# EasyEDA Pro project 蓝牙串口PCB.eprj

# Schematic Schematic1
Board Name: Board1; Create Date: 2025-01-18; Page Name: P1; Project Name: 蓝牙串口; Schematic Name: Schematic1; Update Date: 2026-01-01; Company: 嘉立创EDA; Page Size: A4; Version: V1.0
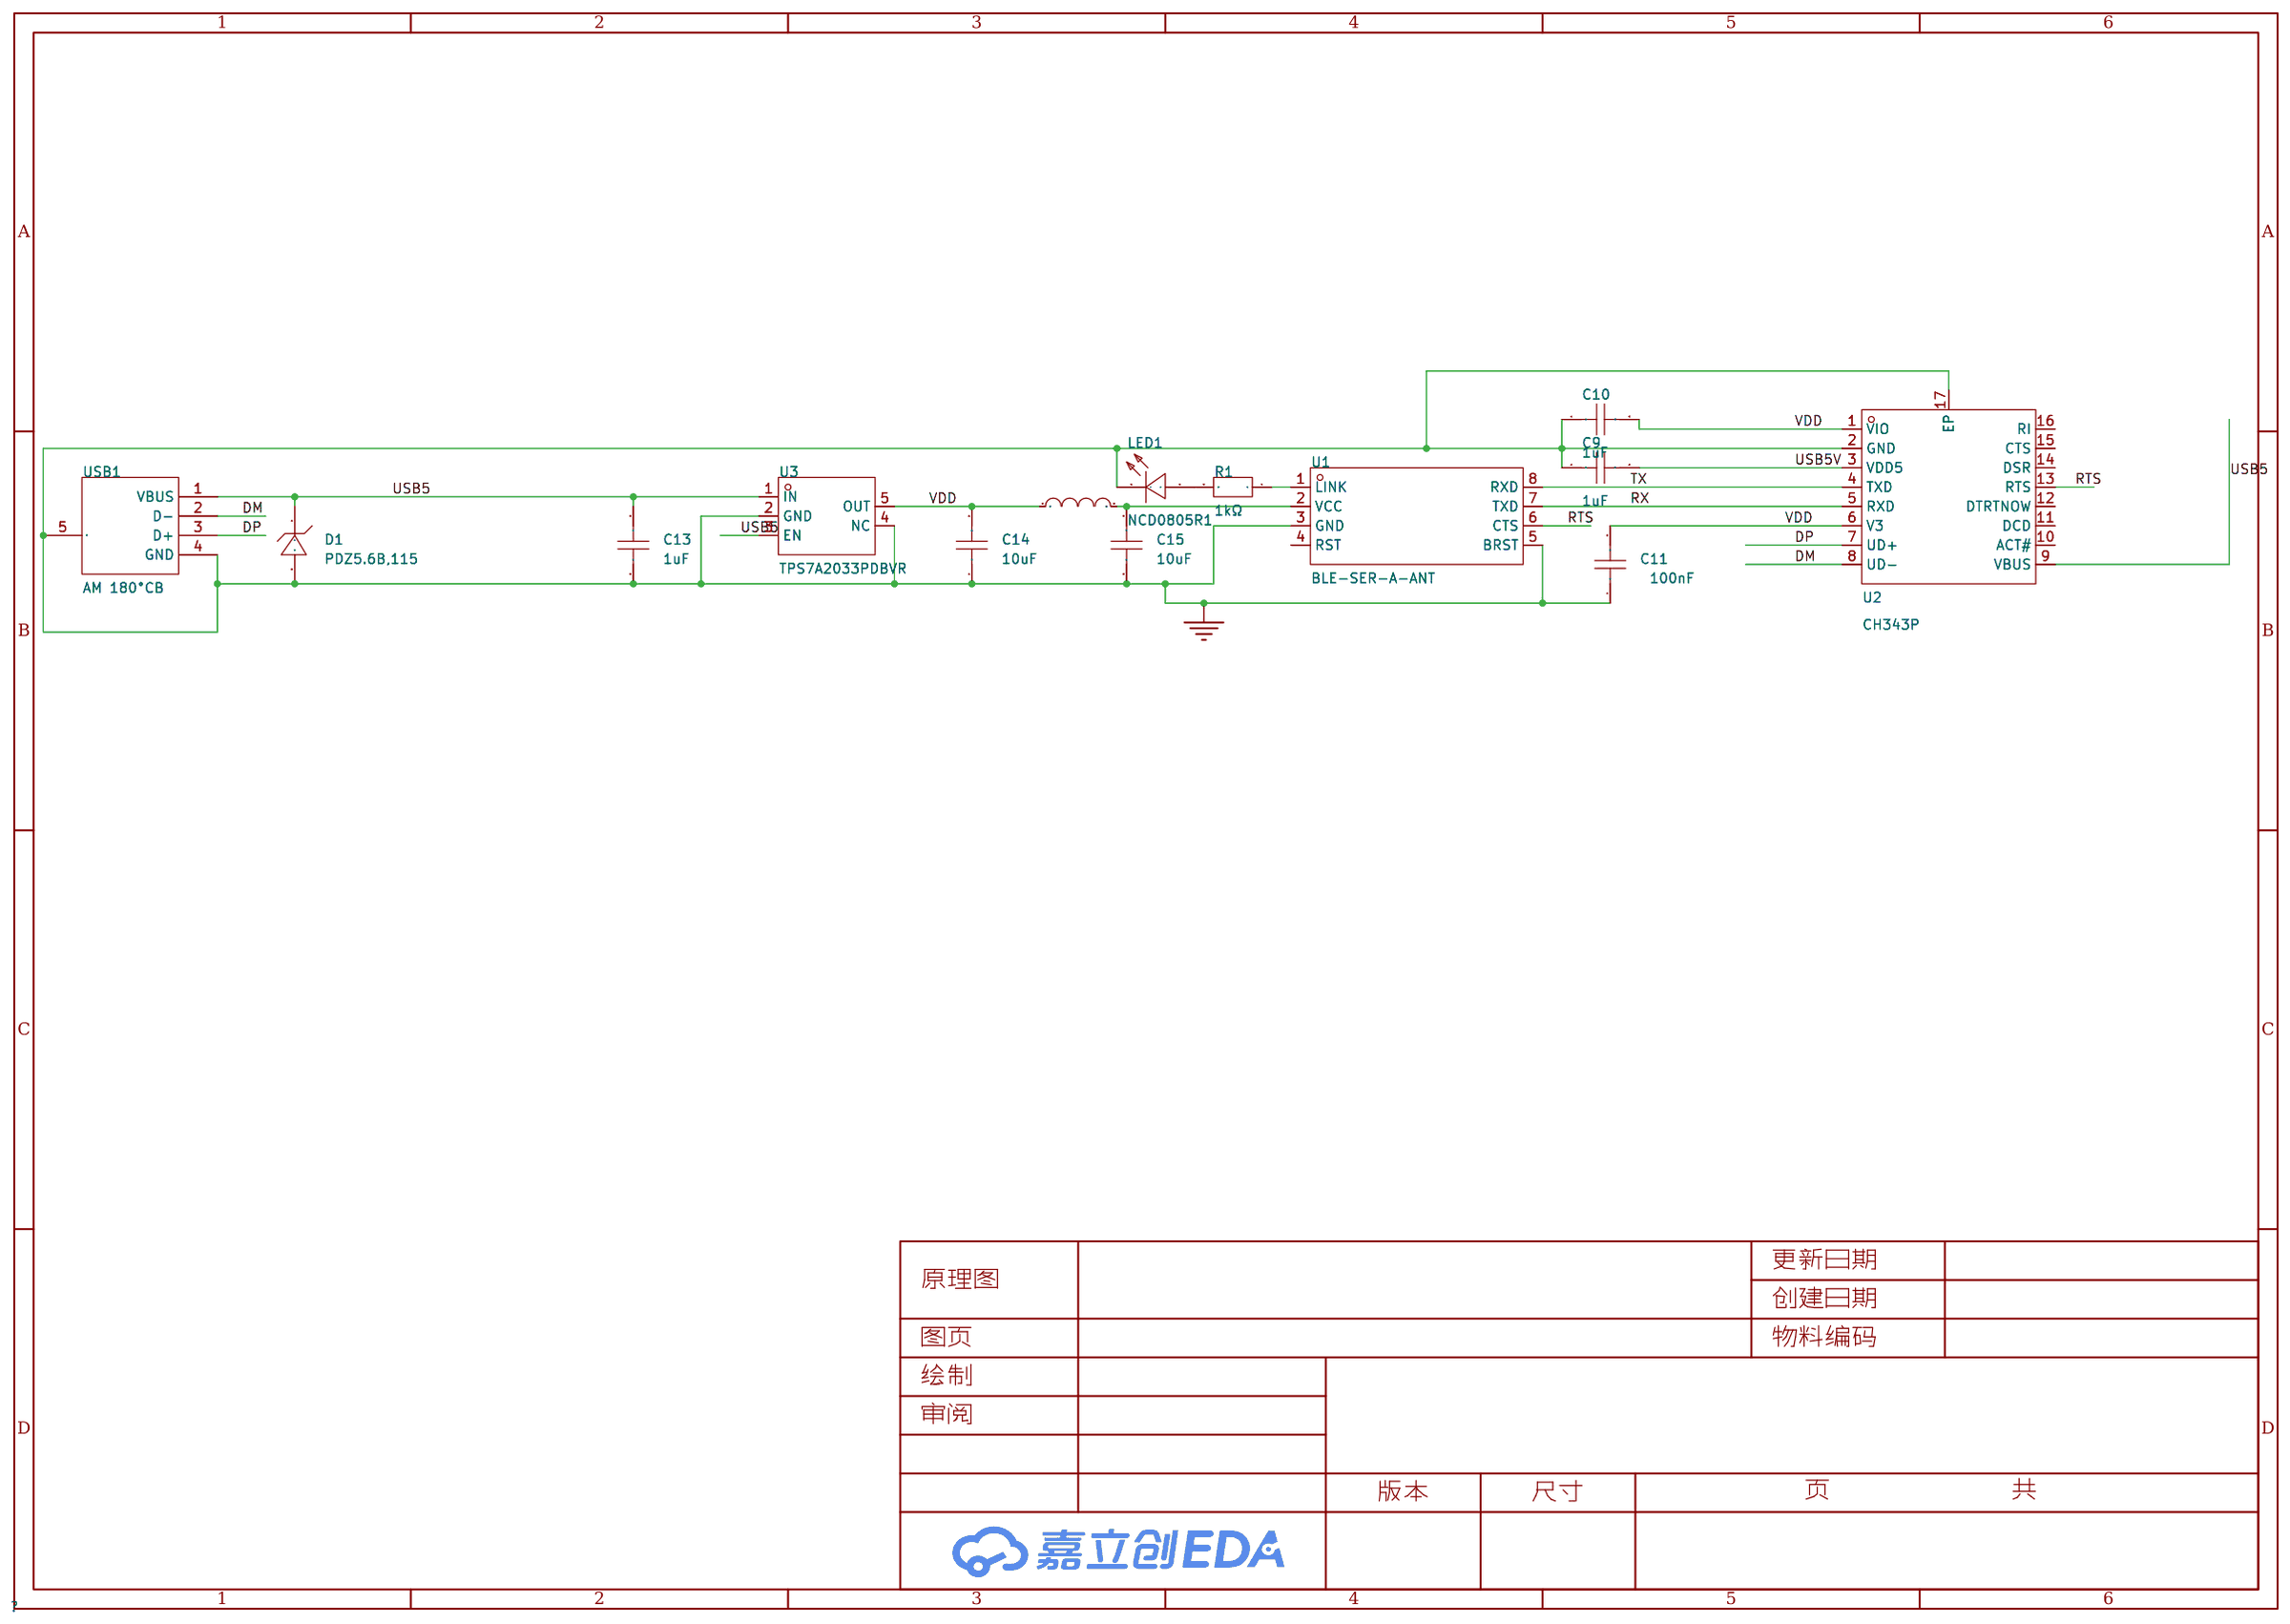
[diagram p0: schematic sheet]

## Parts
C9  1uF  [C0603]
C10  1uF  [C0603]
C11  100nF  [C0603]
C13  1uF  [C0603]
C14  10uF  [C0603]
C15  10uF  [C0603]
D1  PDZ5.6B,115  [SOD-323_L1.7-W1.3-LS2.5-RD]
LED1  NCD0805R1  [LED0805-R-RD]
R1  1kΩ  [R0603]
U1  BLE-SER-A-ANT  [WIFI-SMD_8P-P1.27_CH9140]
U2  CH343P  [TQFN-16_L3.0-W3.0-P0.50-BL-EP1.7]
U3  TPS7A2033PDBVR  [SOT-23-5_L2.9-W1.6-P0.95-LS2.8-BR]
U5  UPZ1608U221-2R2TF  [L0603]
USB1  AM 180°CB  [USB-SMD_AM180CB]

## Library data of the parts
C9 C10 C13 = CL10A105KB8NNNC: LCSC Part Name: 1uF ±10% 50V; Supplier Part: C15849; Manufacturer: SAMSUNG(三星); Supplier Footprint: 0603; JLCPCB Part Class: 基础库; Datasheet: https://item.szlcsc.com/datasheet/CL10A105KB8NNNC/16531.html; Supplier: LCSC; Tolerance: ±10%; Voltage Rating: 50V; Temperature Coefficient: X5R
C11 = CL10B104KB8NNNC: LCSC Part Name: 100nF ±10% 50V; Supplier Part: C1591; Manufacturer: SAMSUNG(三星); Supplier Footprint: 0603; JLCPCB Part Class: 扩展库; Datasheet: https://item.szlcsc.com/datasheet/CL10B104KB8NNNC/1943.html; Supplier: LCSC; Tolerance: ±10%; Voltage Rating: 50V; Temperature Coefficient: X7R
C14 C15 = CL10A106MA8NRNC: LCSC Part Name: 10uF ±20% 25V; Supplier Part: C96446; Manufacturer: SAMSUNG(三星); Supplier Footprint: 0603; JLCPCB Part Class: 基础库; Datasheet: https://item.szlcsc.com/datasheet/CL10A106MA8NRNC/97651.html; Supplier: LCSC; Tolerance: ±20%; Voltage Rating: 25V; Temperature Coefficient: X5R
D1 = PDZ5.6B,115: Supplier Part: C74713; Manufacturer: Nexperia(安世); Supplier Footprint: SOD-323; JLCPCB Part Class: 扩展库; Datasheet: https://item.szlcsc.com/datasheet/PDZ5.6B%252C115/75835.html; Supplier: LCSC; Diode Configuration: 独立式; Zener Voltage(Nom): 5.6V; Reverse Leakage Current (Ir): 1uA@2.5V; Zener Voltage(Range): 5.48V~5.73V; Pd - Power Dissipation: 400mW; Impedance(Zzt): 50Ω
LED1 = NCD0805R1: Supplier Part: C84256; Manufacturer: 国星光电; Supplier Footprint: 0805; JLCPCB Part Class: 基础库; Datasheet: https://atta.szlcsc.com/upload/public/pdf/source/20200820/C84256_F0A75A43B3EAD75808600A0514C76B99.pdf; Supplier: LCSC; Emitted Color: 红色; Forward Voltage (VF): 1.6V~2.6V; Power Dissipation: 65mW; Forward Current: 20mA; Dominant Wavelength: 615nm~630nm; Diode Configuration: 独立二极管; Lens Color: 无色透明透镜; Luminous Intensity: 67mcd~195mcd; Viewing Angle: 130°; Operating Temperature: -30℃~+85℃
R1 = FRC0603F1001TS: LCSC Part Name: 1kΩ ±1% 100mW 厚膜电阻; Supplier Part: C2907002; Manufacturer: FOJAN(富捷); Supplier Footprint: 0603; JLCPCB Part Class: 扩展库; Supplier: LCSC; Type: 厚膜电阻; Tolerance: ±1%; Power(Watts): 100mW; Voltage-Supply(Max): 75V; Temperature Coefficient: ±100ppm/℃; Operating Temperature: -55℃~+155℃
U1 = BLE-SER-A-ANT: LCSC Part Name: CH9140蓝牙转串口模块; Supplier Part: C2829462; Manufacturer: WCH(南京沁恒); Supplier Footprint: SMD,10.2x10.6mm; JLCPCB Part Class: 扩展库; Datasheet: https://atta.szlcsc.com/upload/public/pdf/source/20220415/E84741AD8F7214E5FBA61F031309F4A4.pdf; Supplier: LCSC
U2 = CH343P: Supplier Part: C2846043; Manufacturer: WCH(南京沁恒); Supplier Footprint: TQFN-16-EP(3x3); JLCPCB Part Class: 扩展库; Datasheet: https://item.szlcsc.com/datasheet/CH343P/3039795.html; Supplier: LCSC; Applications Function: USB转UART; USB Protocol: USB 2.0; Voltage - Supply: 3.3V；5V; Data Rate: 6Mbps; Operating Temperature: -40℃~+85℃
U3 = TPS7A2033PDBVR: LCSC Part Name: 具有高 PSRR 的 300mA、超低噪声、低 IQ、低压降 (LDO) 线性稳压器; Supplier Part: C2862740; Manufacturer: TI(德州仪器); Supplier Footprint: SOT-23-5; JLCPCB Part Class: 扩展库; Datasheet: https://www.ti.com/cn/lit/gpn/tps7a20; Supplier: LCSC; Output Type: 固定; Maximum Input Voltage: 6V; Output Voltage: 3.3V; Output Current: 300mA; Dropout Voltage: 140mV@(300mA); standby current: 15uA; Feature: 防静电保护；软启动；浪涌保护；低ESR；热保护(TSD)；欠压闭锁；过流保护(OCP)；带使能；防倒灌; Operating Temperature: -40℃~+125℃@(Tj); Output Polarity: 正极; Number of Outputs: 1
U5 = UPZ1608U221-2R2TF: LCSC Part Name: 单路 0603磁珠 阻抗220Ω@100MHz; Supplier Part: C279745; Manufacturer: Sunlord(顺络); Supplier Footprint: 0603; JLCPCB Part Class: 扩展库; Datasheet: https://atta.szlcsc.com/upload/public/pdf/source/20231030/6F67BDFA94A48EA93F9ABB358D1D978C.pdf; Supplier: LCSC; Impedance @ Frequency: 220Ω@100MHz; Tolerance: ±25%; DC Resistance: 50mΩ; Current Rating: 2.2A; Circuits: 1
USB1 = AM 180°CB: LCSC Part Name: Type-A 公 沉板; Supplier Part: C2681565; Manufacturer: SHOU HAN(首韩); Supplier Footprint: SMD; JLCPCB Part Class: 扩展库; Datasheet: https://atta.szlcsc.com/upload/public/pdf/source/20241125/11843FBC989849423C47D779210F0313.pdf; Supplier: LCSC; Connector Type: Type-A; Standard: USB 2.0; Gender: 公; Mounting Style: 沉板; Number of Contacts: 4P; Number of Ports: 1; Current Rating - Power (Max): 1.5A; Rated Voltage (Max): 30V; Connect-Disconnect Life: 5千次; Length: 10mm; Core Colour: 白色; Operating Temperature Range: -25℃~+85℃

## Nets
GND: C9.1 C10.1 C11.1 C13.2 C14.1 C15.1 D1.2(A) LED1.2(-) U1.3(GND) U1.5(BRST) U2.2(GND) U2.17(EP) U3.2(GND) U3.4(NC) USB1.4(GND) USB1.5(EH)
VDD: C10.2 C11.2 C14.2 U2.1(VIO) U2.6(V3) U3.5(OUT) U5.1
DM: U2.8(UD-) USB1.2(D-)
DP: U2.7(UD+) USB1.3(D+)
RTS: U1.6(CTS) U2.13(RTS)
RX: U1.7(TXD) U2.5(RXD)
TX: U1.8(RXD) U2.4(TXD)
USB5: C13.1 D1.1(K) U2.9(VBUS) U3.1(IN) U3.3(EN) USB1.1(VBUS)
USB5V: C9.2 U2.3(VDD5)
$1N1432: C15.2 U1.2(VCC) U5.2
$1N2403: R1.1 U1.1(LINK)
$1N7588: LED1.1(+) R1.2

Not connected (* = marked no-connect by the designer): U1 4(RST); U2 10(ACT#) 11(DCD) 12(DTRTNOW) 14(DSR) 15(CTS) 16(RI)

# Board PCB1
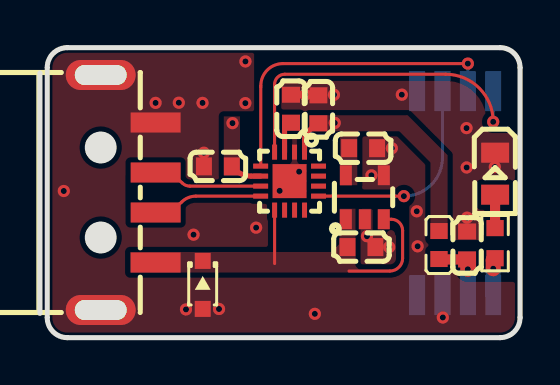
[diagram p1: board, top side]
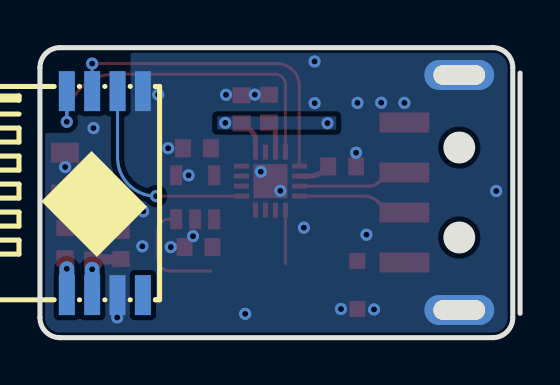
[diagram p2: board, bottom side, seen from below]

Outline 24.04 x 14.5 mm; copper layers: Top Layer, Bottom Layer. Coordinates in mm from the lower left corner of the outline.
Outline path: 0.37,13.5 arc(0.66,14.21) 1.37,14.5 23.04,14.5 arc(23.75,14.21) 24.04,13.5 24.04,1 arc(23.75,0.29) 23.04,0 1.37,0 arc(0.66,0.29) 0.37,1 0.37,13.5
Stack: Top Layer 0.035mm / Dielectric1 1.51mm FR4 er 4.5 / Bottom Layer 0.035mm

## Design rules (mm)
template: 自定义配置
spacing copperThickness1oz (default): track to track 0.102, other pairs 0.152 to 0.3
spacing copperThickness2oz: track to track 0.203, other pairs 0.152 to 0.3
track width copperThickness1oz (default): min 0.127, default 0.254, max 2.54
track width copperThickness2oz: min 0.203, default 0.254, max 2.54
differential pair differentialPair (default): width min 0.127, default 0.254, max 2.54; gap min 0.152, default 0.152
via viaSize (default): diameter min 0.5, default 0.61, max 10; hole min 0.3, default 0.305, max 6.3

## Placement (name value [footprint] x y rotation side)
C9  1uF  [C0603]  12.57 11.45 270 top
C10  1uF  [C0603]  8.91 8.56 0 top
C11  100nF  [C0603]  13.95 11.42 270 top
C13  1uF  [C0603]  16.1 4.53 0 top
C14  10uF  [C0603]  16.19 9.47 180 top
C15  10uF  [C0603]  21.39 4.61 270 top
D1  PDZ5.6B,115  [SOD-323_L1.7-W1.3-LS2.5-RD]  8.15 2.64 270 top
LED1  NCD0805R1  [LED0805-R-RD]  22.8 8.2 270 top
R1  1kΩ  [R0603]  22.79 4.72 90 top
U1  BLE-SER-A-ANT  [WIFI-SMD_8P-P1.27_CH9140]  20.79 7.23 90 bottom
U2  CH343P  [TQFN-16_L3.0-W3.0-P0.50-BL-EP1.7]  12.5 7.83 180 top
U3  TPS7A2033PDBVR  [SOT-23-5_L2.9-W1.6-P0.95-LS2.8-BR]  16.27 7.02 270 top
U5  UPZ1608U221-2R2TF  [L0603]  19.98 4.63 270 top
USB1  AM 180°CB  [USB-SMD_AM180CB]  4.42 7.26 270 top

## Footprints (pads in the part's own frame, mm; a bottom-side part is the same pattern mirrored in y, then rotated)
C0603
  rect 0.8x0.9 smd: 1(-0.7,0) 2(0.7,0)
L0603
  rect 0.8x0.864 smd: 1(-0.7,0) 2(0.7,0)
LED0805-R-RD
  rect 1x1.399 smd: 1(1.05,0) 2(-1.05,0)
R0603
  rect 0.806x0.864 smd: 1(-0.753,0) 2(0.753,0)
SOD-323_L1.7-W1.3-LS2.5-RD
  rect 0.8x0.8 smd: 1(-1.2,0) 2(1.2,0)
SOT-23-5_L2.9-W1.6-P0.95-LS2.8-BR
  rect 1x0.6 smd: 1(1.1,-0.95) 2(1.1,0) 3(1.1,0.95) 4(-1.1,0.95) 5(-1.1,-0.95)
TQFN-16_L3.0-W3.0-P0.50-BL-EP1.7
  rect 0.25x0.75 smd: 1(-0.749,-1.45) 2(-0.248,-1.45) 3(0.252,-1.45) 4(0.751,-1.45) 9(0.75,1.45) 10(0.25,1.45) 11(-0.25,1.45) 12(-0.749,1.45)
  rect 0.75x0.25 smd: 5(1.45,-0.75) 6(1.45,-0.25) 7(1.45,0.25) 8(1.45,0.75) 13(-1.45,0.75) 14(-1.45,0.25) 15(-1.45,-0.25) 16(-1.45,-0.75)
  rect 1.7x1.7 smd: 17(0.001,0)
USB-SMD_AM180CB
  rect 1x2.5 smd: 1(3.5,1.375) 2(1,1.375) 3(-1,1.375) 4(-3.5,1.375)
  oval 1.5x3.5 hole 1x2.6: 5(-5.875,-1.375) 5(5.875,-1.375)
WIFI-SMD_8P-P1.27_CH9140
  rect 2x0.8 smd: 1(-5.1,1.905) 2(-5.1,0.635) 3(-5.1,-0.635) 4(-5.1,-1.905) 5(5.1,-1.905) 6(5.1,-0.635) 7(5.1,0.635) 8(5.1,1.905)

## Nets
As in the schematic.

Pads without a net: U1 4; U2 10 11 12 14 15 16

## Via types
v1: diameter 0.61, hole 0.305, Top Layer to Bottom Layer, 35 vias

## Routing (per net, layer and track width the routed paths; a pad name or vN(x,y) marks a point on that pad's centre or on a via; arc(x,y) is an arc through that point)
GND:
  vias: v1(1.19,7.33) v1(5.79,11.74) v1(6.96,11.75) v1(7.31,1.41) v1(7.69,5.15) v1(8.14,11.74) v1(8.21,9.25) v1(8.97,1.43) v1(10.29,13.81) v1(10.29,11.73) v1(10.83,5.5) v1(12.01,7.34) v1(12.98,8.3) v1(13.28,12.15) v1(13.77,1.19) v1(14.73,12.14) v1(16.38,5.07) v1(16.6,8.12) v1(17.49,4.53) v1(17.62,9.47) v1(18.12,12.15) v1(18.87,6.32) v1(18.91,4.57) v1(20.18,1.01) v1(21.36,10.48) v1(21.37,8.51) v1(21.39,6) v1(22.78,8.53)
VDD: length 3.3
  Top Layer w0.254: U2.6 10.58,8.08 arc(10.13,8.16) 9.75,8.42 C10.2 ; U2.1 13.25,9.91 arc(13.29,10.11) 13.4,10.27 13.77,10.64 arc(13.85,10.7) 13.95,10.72
  vias: v1(9.64,10.72) v1(14.76,10.74)
DM: length 5.5
  Top Layer w0.152: U2.8 7.81,7.08 arc(7.43,7) 7.1,6.78 arc(6.52,6.39) 5.83,6.26 USB1.2
DP: length 5.4
  Top Layer w0.152: U2.7 7.51,7.58 arc(7.3,7.62) 7.13,7.73 arc(6.55,8.12) 5.86,8.26 USB1.3
RTS: length 10.6
  Top Layer w0.152: 18.23,7.08 U2.13
  Bottom Layer w0.152: U1.6 20.16,9.01 arc(19.59,7.64) v1(18.23,7.07)
RX: length 16.4
  Top Layer w0.152: v1(21.43,13.7) 12.17,13.7 arc(11.39,13.38) 11.06,12.6 arc(11.06,12.56) 11.06,12.52 11.06,8.58 arc(11.06,8.58) U2.5
  Bottom Layer w0.152: U1.7 v1(21.43,13.7)
TX: length 17.5
  Top Layer w0.152: U2.4 11.75,12.66 arc(11.9,13.02) 12.26,13.17 20.32,13.17 arc(22,12.47) v1(22.7,10.79)
  Bottom Layer w0.152: U1.8 v1(22.7,10.79)
USB5: length 8.4
  Top Layer w0.152: U3.3 17.6,5.92 arc(18,5.75) 18.16,5.35 18.16,3.97 arc(17.97,3.52) 17.52,3.33 15.48,3.33 ; U2.9 11.75,3.71
USB5V: length 1.7
  Top Layer w0.254: 12.53,10.75 12.25,10.75 U2.3
$1N1432: length 3.2
  Top Layer w0.508: C15.2 20,3.91 arc(19.99,3.92) U5.2
  Top Layer w0.75: v1(21.43,3.42) 21.43,3.87 arc(21.42,3.9) C15.2
  Bottom Layer w0.75: v1(21.43,3.42) 21.43,2.17 21.41,2.15 arc(21.41,2.13) U1.2
$1N2403: length 1.9
  Top Layer w0.75: v1(22.7,3.44) 22.7,3.88 arc(22.73,3.94) R1.1
  Bottom Layer w0.75: 22.7,3.44 U1.1
$1N7588: length 1.7
  Top Layer w0.508: R1.2 22.79,7.14 arc(22.79,7.15) LED1.1

## Copper pours and planes (outline as drawn; the poured copper is in the pictures)
GND on Top Layer: 29.99,-4.39 -1.36,-4.39 -1.36,17.16 29.99,17.16
GND on Bottom Layer: 30.08,-4.67 -1.27,-4.67 -1.27,17.22 30.08,17.22
VDD on Top Layer: 17.8,11.12 20.42,11.12 20.42,8.51 17.8,8.51
VDD on Top Layer: 19.56,9.12 20.42,9.12 20.42,4.94 19.56,4.94
VDD on Top Layer: 9.21,11.06 10.02,11.06 10.02,8.12 9.21,8.12
VDD on Top Layer: 13.5,11.12 18.41,11.12 18.41,10.32 13.5,10.32
VDD on Top Layer: 15.02,11.05 15.89,11.05 15.89,7.62 15.02,7.62
VDD on Bottom Layer: 9.21,11.06 15.17,11.06 15.17,10.4 9.21,10.4
USB5 on Top Layer: 14.24,4.93 15.51,4.93 15.51,3.66 14.24,3.66
USB5 on Top Layer: 4.52,4.28 15.8,4.28 15.8,3.26 4.52,3.26
USB5 on Top Layer: 15,6.45 15.8,6.45 15.8,3.71 15,3.71

Small or netless copper shapes (teardrops, artwork), in the pictures only: 1 on Top Layer
